# EAGLE design JSDM Wemos Mini DS3231 3x HUB12 Single (EAGLE 7.7.0)
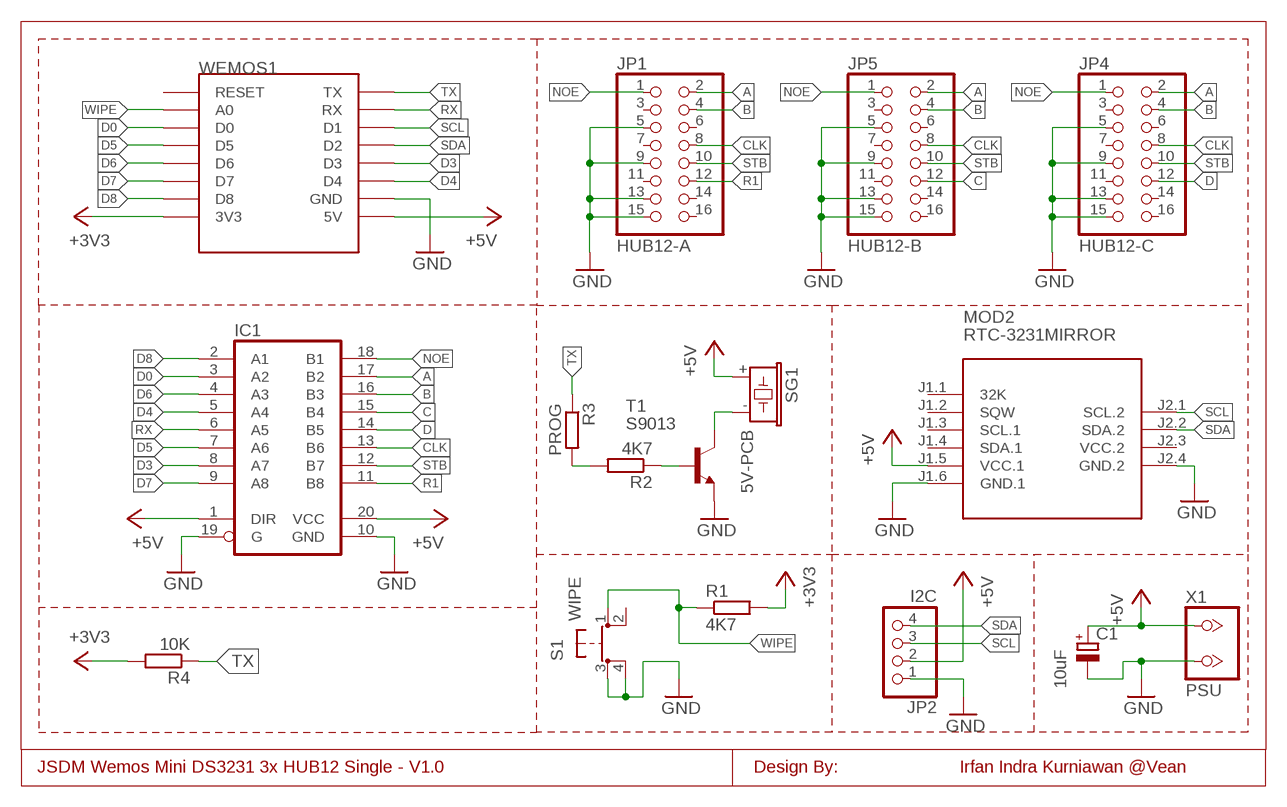
[diagram p0: schematic, sheet 1]

## Parts
C1  10uF  CPOL-EUE3.5-8  [E3,5-8]
IC1  74245SMD  [SO20]
JP1  HUB12-A  PINHD-2X8  [2X08]
JP2  I2C  PINHD-1X4  [1X04]
JP4  HUB12-C  PINHD-2X8  [2X08]
JP5  HUB12-B  PINHD-2X8  [2X08]
MOD2  RTC-3231MIRROR  [RTC-DS3231-MIRROR]
R1  4K7  R-EU_0207/12  [0207/12]
R2  4K7  R-EU_0207/7  [0207/7]
R3  PROG  R-EU_M0805  [M0805]
R4  10K  R-EU_0207/12  [0207/12]
S1  WIPE  TACT-6X6OCT  [TACT-6X6MM-OCTAGON]
SG1  5V-PCB  [5V]
T1  S9013  BC317-NPN-TO92-EBC  [TO92-EBC]
WEMOS1  WEMOS-D1-MINI  [WEMOS-D1-MINI]
X1  PSU  2PIN  [TB2]

## Nets
+3V3: R1.2 R4.2 WEMOS1.3V3
+5V: C1.+ IC1.1(DIR) IC1.20(VCC) JP2.2 MOD2.J1.5(VCC.1) SG1.+ WEMOS1.5V X1.1
A: IC1.17(B2) JP1.2 JP4.2 JP5.2
B: IC1.16(B3) JP1.4 JP4.4 JP5.4
C: IC1.15(B4) JP5.12
CLK: IC1.13(B6) JP1.8 JP4.8 JP5.8
D: IC1.14(B5) JP4.12
D0: IC1.3(A2) WEMOS1.D0
D3: IC1.8(A7) WEMOS1.D3
D4: IC1.5(A4) WEMOS1.D4
D5: IC1.7(A6) WEMOS1.D5
D6: IC1.4(A3) WEMOS1.D6
D7: IC1.9(A8) WEMOS1.D7
D8: IC1.2(A1) WEMOS1.D8
GND: C1.- IC1.10(GND) IC1.19(G) JP1.5 JP1.9 JP1.13 JP1.15 JP2.1 JP4.5 JP4.9 JP4.13 JP4.15 JP5.5 JP5.9 JP5.13 JP5.15 MOD2.J1.6(GND.1) MOD2.J2.4(GND.2) S1.3(P) S1.4(P1) T1.E WEMOS1.GND X1.2
N$2: SG1.- T1.C
N$3: R2.1 T1.B
N$6: R2.2 R3.2
NOE: IC1.18(B1) JP1.1 JP4.1 JP5.1
R1: IC1.11(B8) JP1.12
RX: IC1.6(A5) WEMOS1.RX
SCL: JP2.3 MOD2.J2.1(SCL.2) WEMOS1.D1
SDA: JP2.4 MOD2.J2.2(SDA.2) WEMOS1.D2
STB: IC1.12(B7) JP1.10 JP4.10 JP5.10
TX: R3.1 R4.1 WEMOS1.TX
WIPE: R1.1 S1.1(S) WEMOS1.A0
Unconnected: JP1.3 JP1.6 JP1.7 JP1.11 JP1.14 JP1.16 JP4.3 JP4.6 JP4.7 JP4.11 JP4.14 JP4.16 JP5.3 JP5.6 JP5.7 JP5.11 JP5.14 JP5.16 MOD2.J1.1(32K) MOD2.J1.2(SQW) MOD2.J1.3(SCL.1) MOD2.J1.4(SDA.1) S1.2(S1) WEMOS1.RESET

## Notes on the sheet
- JSDM Wemos Mini DS3231 3x HUB12 Single - V1.0 | Design By: | Irfan Indra Kurniawan @Vean

## Power pins joined to a net without a drawn wire
VCC.2: MOD2.J2.3(VCC.2)

## Library data of the parts
C1 = FansElectronics-RCL:CPOL-EU: POLARIZED CAPACITOR, European symbol
IC1 = FansElectronics-IC-74xx:74*245
JP1 JP4 JP5 = FansElectronics-Header:PINHD-2X8: PIN HEADER
JP2 = FansElectronics-Header:PINHD-1X4: PIN HEADER
MOD2 = FansElectronics-Modul:RTC-3231
R1-R4 = FansElectronics-RCL:R-EU_: RESISTOR, European symbol
S1 = FansElectronics-Switch:TACT: TACT SWITCH biasa juga disebut Switch Omron / Micro Switch
SG1 = FansElectronics-Buzzer:5V-PCB: Buzzer 5V on PCB
T1 = transistor:*-NPN-: NPN Transistror BF959 corrected 2008.03.06
WEMOS1 = esp8266modules:WEMOS-D1-MINI: WeMos.cc D1 mini ESP8266 module
X1 = FansElectronics-Con-Screw:2PIN

## Board
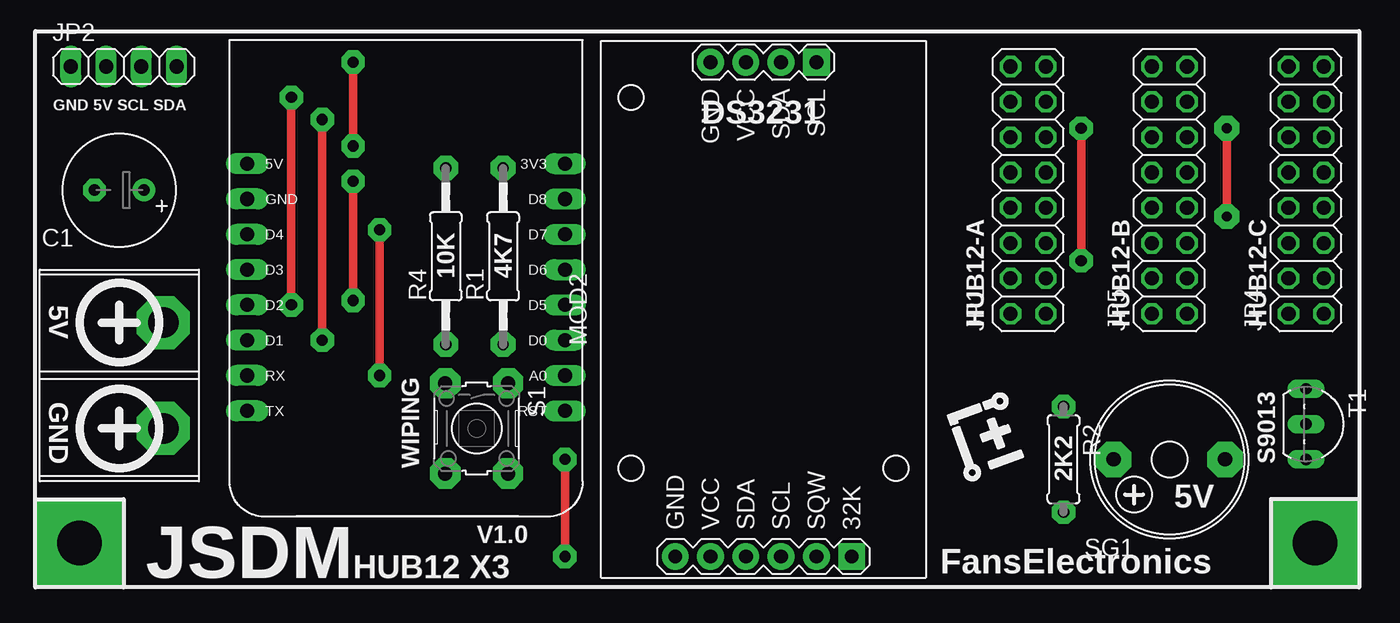
[diagram p1: board, top side]
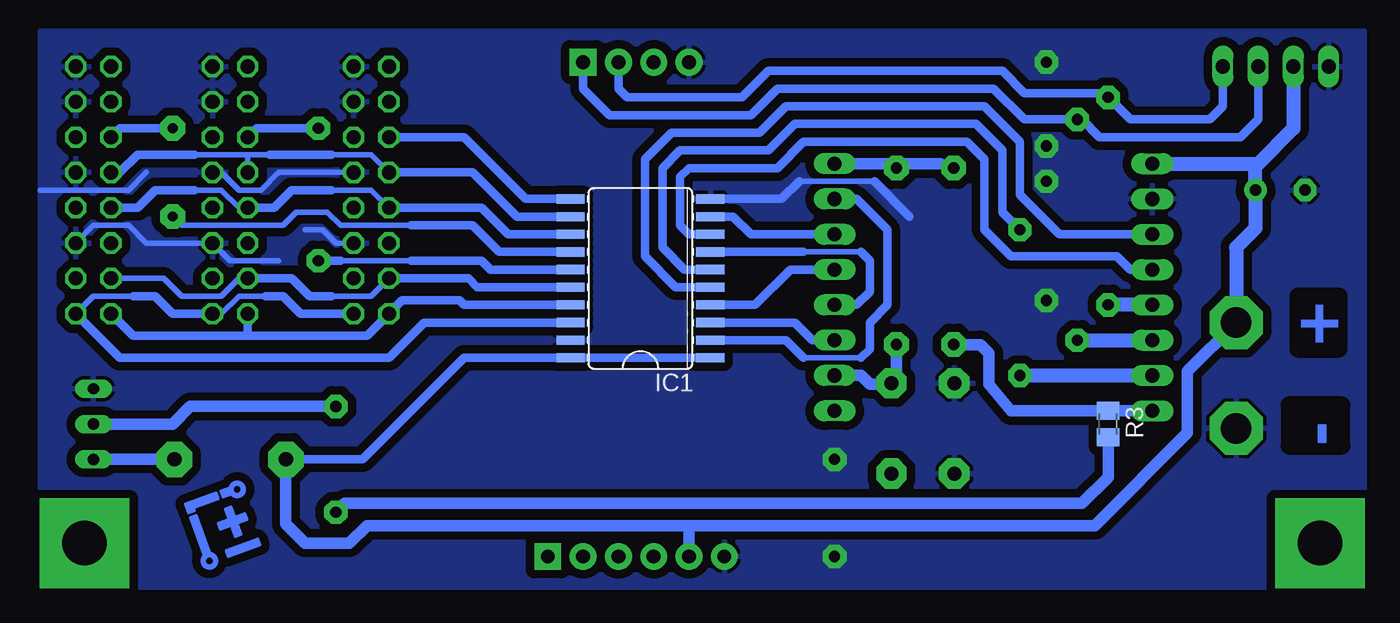
[diagram p2: board, bottom side, seen from below]

No outline drawn. Coordinates in mm, seen from the top.
Copper layers (1*16): Top 0.035mm / dielectric 1.5mm / Bottom 0.035mm
Design rules "default": minimum track width 10mil, minimum drill 24mil, track to track 8mil, track to pad 8mil, pad to pad 8mil, via to via 8mil, smd to smd 8mil, copper to edge 40mil, drill to drill 8mil, minimum pad ring 10mil, minimum via ring 8mil, stop-mask expansion 4mil, vias tented up to drill 0mil, thermal gap 10mil

### Footprints (pad centres in the part's own frame; a part is rotated, then mirrored left to right if it is on the bottom)
E3,5-8 = drill 0.813 pad 1.6: + -1.778,0 | drill 0.813 pad 1.6 octagon: - 1.778,0
SO20 = smd 0.66 x 2.032: 1 -5.715,-5.029; 2 -4.445,-5.029; 3 -3.175,-5.029; 4 -1.905,-5.029; 5 -0.635,-5.029; 6 0.635,-5.029; 7 1.905,-5.029; 8 3.175,-5.029; 9 4.445,-5.029; 10 5.715,-5.029; 11 5.715,5.029; 12 4.445,5.029; 13 3.175,5.029; 14 1.905,5.029; 15 0.635,5.029; 16 -0.635,5.029; 17 -1.905,5.029; 18 -3.175,5.029; 19 -4.445,5.029; 20 -5.715,5.029
2X08 = drill 1.016 octagon: 1 -8.89,-1.27; 2 -8.89,1.27; 3 -6.35,-1.27; 4 -6.35,1.27; 5 -3.81,-1.27; 6 -3.81,1.27; 7 -1.27,-1.27; 8 -1.27,1.27; 9 1.27,-1.27; 10 1.27,1.27; 11 3.81,-1.27; 12 3.81,1.27; 13 6.35,-1.27; 14 6.35,1.27; 15 8.89,-1.27; 16 8.89,1.27
1X04 = drill 1.016 long: 1 -3.81,0; 2 -1.27,0; 3 1.27,0; 4 3.81,0
RTC-DS3231-MIRROR = drill 1 pad 1.93 square: J1.1 -17.78,-6.35; J2.1 17.78,-3.81 | drill 1 pad 1.93: J1.2 -17.78,-3.81; J1.3 -17.78,-1.27; J1.4 -17.78,1.27; J1.5 -17.78,3.81; J1.6 -17.78,6.35; J2.2 17.78,-1.27; J2.3 17.78,1.27; J2.4 17.78,3.81
0207/12 = drill 0.813 pad 1.778 octagon: 1 -6.35,0; 2 6.35,0
0207/7 = drill 0.813 pad 1.676 octagon: 1 -3.81,0; 2 3.81,0
M0805 = smd 1.3 x 1.6: 1 -0.95,0; 2 0.95,0
TACT-6X6MM-OCTAGON = drill 1.016 pad 2.184 octagon: 1 -3.251,2.261; 2 3.251,2.261; 3 -3.251,-2.261; 4 3.251,-2.261
5V = drill 1.016 pad 2.54 octagon: + 4.01,0; - -4.01,0
TO92-EBC = drill 0.813 long: B 0,-1.27; C 2.54,-1.27; E -2.54,-1.27
WEMOS-D1-MINI = drill 1.016 long: 3V3 -11.43,-8.89; 5V 11.43,-8.89; A0 -11.43,6.35; D0 -11.43,3.81; D1 11.43,3.81; D2 11.43,1.27; D3 11.43,-1.27; D4 11.43,-3.81; D5 -11.43,1.27; D6 -11.43,-1.27; D7 -11.43,-3.81; D8 -11.43,-6.35; GND 11.43,-6.35; RESET -11.43,8.89; RX 11.43,6.35; TX 11.43,8.89
TB2 = drill 2.2 pad 3.81 octagon: 1 -3.81,0; 2 3.81,0

### Placement (x,y rotation side)
C1  31.43,53.34 180 top
IC1  77.47,46.99 90 bottom
JP1  96.84,53.34 90 top
JP2  31.75,62.23 0 top
JP4  116.84,53.34 90 top
JP5  107,53.34 90 top
MOD2  77.79,44.77 90 top
R1  59.05,48.58 90 top
R2  99.38,33.97 270 top
R3  43.81,36.51 270 bottom
R4  54.93,48.58 90 top
S1  57.15,36.2 270 top
SG1  107,33.97 180 top
T1  118.11,36.51 270 top
WEMOS1  52.07,46.35 180 top
X1  34.61,40.01 270 top

### Tracks (layer width: path | path; a pad name or v marks a point on that pad's centre or on a via)
+3V3
  Bottom 0.813: WEMOS1.3V3 59.37,55.24 | 59.37,55.24 55.88,55.24 R4.2 | R1.2 59.37,54.93 59.37,55.24
+5V
  Bottom 0.61: IC1.20 IC1.1 90.17,41.27 97.47,33.97 SG1.+
  Bottom 0.813: MOD2.J1.5 73.98,29.21 | 73.98,29.21 97.16,29.21 98.42,27.94 101.6,27.94 102.99,29.33 SG1.+ | X1.1 38.1,40.32 38.1,35.88 44.77,29.21 73.98,29.21
  Bottom 1.016: WEMOS1.5V 33.02,55.24 | 33.02,55.24 30.48,57.78 JP2.2 | 33.02,55.24 33.21,55.05 C1.+ 33.21,50.61 34.61,49.21 X1.1
A
  Bottom 0.61: IC1.17 90.17,45.09 90.49,45.4 94.61,45.4 JP1.2 97.16,42.86 105.73,42.86 | 105.73,42.86 113.98,42.86 JP4.2 | JP5.2 105.73,42.86
B
  Bottom 0.406: JP1.4 96.84,45.72 99.69,45.72 | JP5.4 106.36,46.99 107.63,45.72 110.49,45.72 111.76,46.99 JP4.4
  Bottom 0.61: IC1.16 89.22,46.35 89.85,46.99 JP1.4 | 99.69,45.72 101.28,45.72 102.55,46.99 JP5.4
C  (via drill 0.8 pad 1.68)
  Top 0.61: v100.65,48.26 v100.65,57.78
  Bottom 0.406: 93.98,48.26 99.06,48.26
  Bottom 0.61: IC1.15 88.27,47.62 88.9,48.26 93.98,48.26 | 99.06,48.26 v100.65,48.26 | v100.65,57.78 105.09,57.78 JP5.12
CLK
  Bottom 0.406: JP1.8 96.84,53.34 99.69,53.34 | JP5.8 106.36,52.07 107.63,53.34 109.54,53.34
  Bottom 0.61: JP1.8 88.9,52.07 87,50.16 IC1.13 | 99.69,53.34 102.55,53.34 103.82,52.07 JP5.8 | 109.54,53.34 112.39,53.34 113.67,52.07 JP4.8
D  (via drill 0.7 pad 1.78)
  Top 0.61: v111.12,51.44 v111.12,57.78
  Bottom 0.406: 93.98,50.8 99.06,50.8 100.01,51.75 102.23,51.75 103.19,50.8 110.49,50.8 v111.12,51.44
  Bottom 0.61: IC1.14 87.63,48.9 89.53,50.8 93.98,50.8 | v111.12,57.78 114.94,57.78 JP4.12
D0
  Bottom 0.61: IC1.3 66.36,43.81 65.09,42.55 WEMOS1.D0
D3
  Bottom 0.61: IC1.8 73.98,50.16 74.61,50.8 74.61,54.29 73.98,54.93 67.63,54.93 65.72,56.83 53.98,56.83 52.7,55.56 52.7,50.48 50.8,48.58 43.18,48.58 42.23,47.62 WEMOS1.D3
D4
  Bottom 0.61: IC1.5 74.93,46.35 77.15,48.58 77.15,55.56 75.25,57.47 68.9,57.47 66.99,59.37 52.7,59.37 50.16,56.83 50.16,53.02 47.31,50.16 WEMOS1.D4
D5
  Bottom 0.406: 65.72,48.9 61.59,48.9
  Bottom 0.61: 61.59,48.9 60.96,48.26 60.96,46.04 61.91,45.09 WEMOS1.D5 | IC1.7 65.72,48.9
D6
  Bottom 0.61: WEMOS1.D6 66.67,47.62 69.22,45.09 IC1.4
D7
  Bottom 0.61: IC1.9 70.8,51.44 69.53,50.16 WEMOS1.D7
D8
  Bottom 0.406: 61.59,41.27 65.72,41.27
  Bottom 0.61: WEMOS1.D8 61.91,52.7 59.69,50.48 59.69,45.09 60.96,43.81 60.96,41.91 61.59,41.27 | 65.72,41.27 66.99,42.55 IC1.2
GND  (via drill 0.8 pad 1.68)
  Top 0.61: v63.5,33.97 v63.5,26.99 | v48.26,62.55 v48.26,56.52 | v48.26,53.98 v48.26,45.4
  Bottom 0.406: 66.04,53.98 60.64,53.98 | 103.5,48.26 107,48.26 JP5.5 113.03,49.53 114.3,50.8 116.84,50.8 JP4.5 | 107.63,54.61 106.36,53.34 104.78,53.34 103.5,54.61 JP1.9 | 113.03,54.61 114.3,53.34 120.65,53.34 | JP1.5 99.38,49.53 100.33,50.48 101.6,50.48
  Bottom 0.61: IC1.10 67.31,52.7 66.04,53.98 | 60.64,53.98 58.1,51.44
  pour Bottom (isolate 0.61): 25.4,64.77 120.65,64.77 120.65,24.77 25.4,24.77
N$2
  Bottom 0.813: SG1.- T1.C
N$3
  Bottom 0.813: T1.B 111.12,36.51 109.86,37.78 R2.1
N$4  (via drill 3.2 pad 6.45)
  other vias: 117.47,27.94
N$5  (via drill 3.2 pad 6.45)
  other vias: 28.57,27.94
N$6
  Bottom 0.813: R3.2 43.81,32.7 45.72,30.8 98.74,30.8 R2.2
NOE
  Bottom 0.406: 113.98,45.72 116.84,45.72 JP4.1 | 104.46,45.72 106.36,45.72 107.63,44.45 JP5.1
  Bottom 0.61: IC1.18 93.03,43.81 95.57,41.27 114.94,41.27 JP4.1 | JP1.1 101.92,44.45 103.19,45.72 104.46,45.72 | 113.98,45.72 112.39,45.72 111.12,44.45 JP5.1
R1
  Bottom 0.61: IC1.11 85.72,52.7 90.17,57.15 JP1.12
RX  (via drill 0.8 pad 1.68)
  Top 0.61: v50.16,50.48 v50.16,40.01
  Bottom 0.61: IC1.6 74.3,47.62 75.88,49.21 75.88,54.93 74.61,56.2 68.26,56.2 66.36,58.1 53.34,58.1 51.44,56.2 51.44,51.75 v50.16,50.48
  Bottom 1.016: v50.16,40.01 WEMOS1.RX
SCL  (via drill 0.8 pad 1.68)
  Top 0.61: v46.04,58.42 v46.04,42.55
  Bottom 0.61: JP2.3 33.02,58.42 34.29,57.15 44.45,57.15 45.72,58.42 v46.04,58.42 49.85,58.42 52.07,60.64 67.63,60.64 69.53,58.74 79.69,58.74 81.6,60.64 MOD2.J2.1
  Bottom 1.016: v46.04,42.55 WEMOS1.D1
SDA  (via drill 0.8 pad 1.68)
  Top 0.61: v43.81,45.09 v43.81,60.01
  Bottom 0.61: JP2.4 35.56,59.37 36.51,58.42 42.23,58.42 v43.81,60.01 44.13,60.33 49.85,60.33 51.44,61.91 68.26,61.91 70.17,60.01 78.42,60.01 79.06,60.64 MOD2.J2.2
  Bottom 1.016: WEMOS1.D2 v43.81,45.09
STB
  Bottom 0.406: 99.69,55.88 96.84,55.88 JP1.10 | 104.14,55.88 105.73,55.88 | 105.73,55.88 109.54,55.88 | JP5.10 105.73,55.88
  Bottom 0.61: JP1.10 89.53,54.61 86.36,51.44 IC1.12 | 99.69,55.88 104.14,55.88 | 109.54,55.88 113.67,55.88 114.94,54.61 JP4.10
TX
  Bottom 0.813: WEMOS1.TX R3.1 50.8,37.47 52.39,39.37 52.39,41.59 53.02,42.23 R4.1
WIPE
  Bottom 0.813: R1.1 59.05,39.8 S1.1 59.49,39.37 60.96,39.37 61.59,40.01 WEMOS1.A0
(copper drawn outside any net)
  shapes: Bottom area x6060

### Text on the board
Bottom: + | -
tPlace: GND 5V SCL SDA | DS3231 | 10K | 4K7 | 5V | HUB12-A | HUB12-B | HUB12-C | GND | S9013 | WIPING | 2K2 | 5V | V1.0 | FansElectronics | JSDM | HUB12 X3